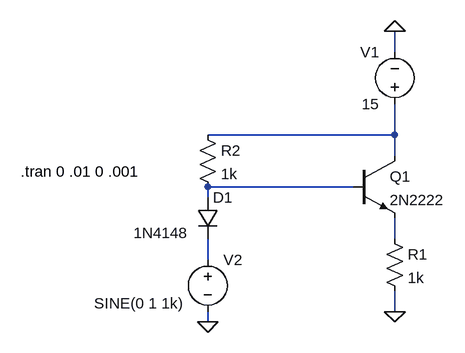
[diagram p0: schematic E_follow_diode.asc]
E_follow_diode.asc, the LTspice schematic file:
Version 4.1
SHEET 1 880 680
WIRE 352 -96 352 -128
WIRE 352 32 352 -16
WIRE 352 32 64 32
WIRE 352 64 352 32
WIRE 288 112 64 112
WIRE 64 128 64 112
WIRE 352 192 352 160
WIRE 64 224 64 192
WIRE 352 304 352 272
WIRE 64 320 64 304
FLAG 352 304 0
FLAG 352 -128 0
FLAG 64 320 0
SYMBOL npn 288 64 R0
SYMATTR InstName Q1
SYMATTR Value 2N2222
SYMBOL res 336 176 R0
SYMATTR InstName R1
SYMATTR Value 1k
SYMBOL voltage 352 0 R180
WINDOW 0 24 96 Left 2
WINDOW 3 24 16 Left 2
WINDOW 123 0 0 Left 0
WINDOW 39 0 0 Left 0
SYMATTR InstName V1
SYMATTR Value 15
SYMBOL voltage 64 208 R0
WINDOW 3 -175 83 Left 2
WINDOW 123 0 0 Left 0
WINDOW 39 0 0 Left 0
SYMATTR InstName V2
SYMATTR Value SINE(0 1 1k)
SYMBOL diode 48 128 R0
WINDOW 3 -98 55 Left 2
SYMATTR InstName D1
SYMATTR Value 1N4148
SYMBOL res 48 16 R0
SYMATTR InstName R2
SYMATTR Value 1k
TEXT -224 88 Left 2 !.tran 0 .01 0 .001

The netlist it stands for:
* E_follow_diode.asc
Q1 N001 N002 N003 0 2N2222
R1 N003 0 1k
V1 N001 0 15
V2 N004 0 SINE(0 1 1k)
D1 N002 N004 1N4148
R2 N001 N002 1k
.model D D
.lib standard.dio
.model NPN NPN
.model PNP PNP
.lib standard.bjt
.tran 0 .01 0 .001
.backanno
.end